# Altium schematic sheet signal-light-12.SchDoc
size A4; SheetNumber: 15; SheetTotal: 21
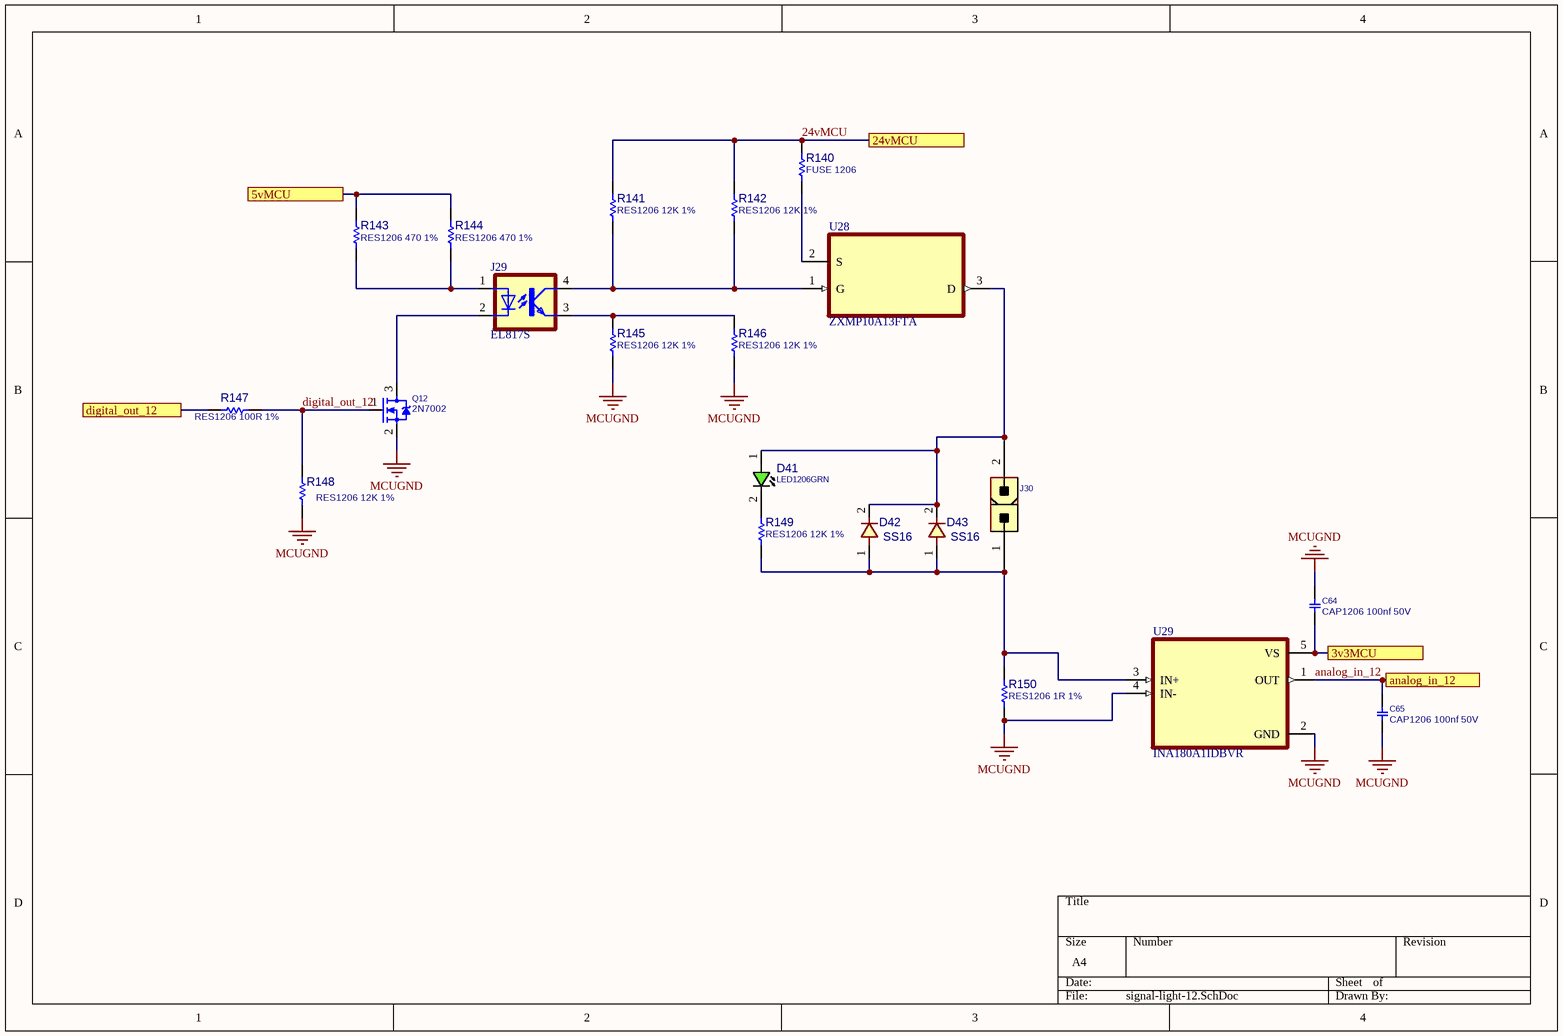
[diagram p0: signal-light-12.SchDoc]

## Parts
C64  CAP1206 100nf 50V  [C1206]
C65  CAP1206 100nf 50V  [C1206]
D41  LED1206GRN  [LED1206GRN]
D42  SS16  [D_SMA]
D43  SS16  [D_SMA]
J29  EL817S  [SOIC254P1030X460-4N]
J30  CONN_ATXPWR_2  [ATXPWR_2]  (value not drawn)
Q12  2N7002  [SOT23_3]
R140  FUSE 1206  [R1206]
R141  RES1206 12K 1%  [R1206]
R142  RES1206 12K 1%  [R1206]
R143  RES1206 470 1%  [R1206]
R144  RES1206 470 1%  [R1206]
R145  RES1206 12K 1%  [R1206]
R146  RES1206 12K 1%  [R1206]
R147  RES1206 100R 1%  [R1206]
R148  RES1206 12K 1%  [R1206]
R149  RES1206 12K 1%  [R1206]
R150  RES1206 1R 1%  [R1206]
U28  ZXMP10A13FTA  [SOT95P230X110-3N]
U29  INA180A1IDBVR  [SOT95P280X145-5N]

## Ports
3v3MCU, 5vMCU, 24vMCU, analog_in_12, digital_out_12

## Nets
MCUGND: C64.1 C65.2 Q12.2(SOURCE) R145.2 R146.2 R148.2 R150.2 U29.2(GND) U29.4(IN-)
3v3MCU: C64.2 U29.5(VS) ; port 3v3MCU
5vMCU: R143.2 R144.2 ; port 5vMCU
24vMCU: R140.1 R141.1 R142.1 ; port 24vMCU
analog_in_12: C65.1 U29.1(OUT) ; port analog_in_12
digital_out_12: Q12.1(GATE) R147.2 R148.1
digital_out_12: R147.1 ; port digital_out_12  [a separate net that carries the same name]
NetD41_1: D41.1(ANODE) D42.2 D43.2 J30.2 U28.3(D)
NetD41_2: D41.2(CATHODE) R149.1
NetD42_1: D42.1 D43.1 J30.1 R149.2 R150.1 U29.3(IN+)
NetJ29_1: J29.1(A) R143.1 R144.1
NetJ29_2: J29.2(C) Q12.3(DRAIN)
NetJ29_3: J29.3(EMIT) R145.1 R146.1
NetJ29_4: J29.4(COL) R141.2 R142.2 U28.1(G)
NetR140_2: R140.2 U28.2(S)

## Library data of the parts
C64 C65 = CAP_SMD_MLCC_1206: CAP, MLCC; PARAM: -, -%; MANF_P#: MANF_PART#; PARAM2: -V; PRICE: 100= 1$; MANF: -; ASSEMBLY: ASSEMBLY
D41 = LED_SMD_1206_GRN: LED, SMD, 1206, GREEN; PARAM: 20mA; DESC: DESCRIPTION; PARAM2: 2.2V; MANF: -; ASSEMBLY: ASSEMBLY; PRICE: 36t@Javan; MANF_P#: -; VALUE: LED1206GRN; MountType: SMT; PartType: LED
D42 D43 = DIODE_SMD_1N4001: DIODE, GENERAL PURPOSE, 50V/1A; DESC: DESCRIPTION; PARAM: 50V VRRM; PARAM2: 1A; MANF_P#: 1N4001; MANF: MANF; ASSEMBLY: ASSEMBLY; PRICE: PRICE; VALUE: SS16
J29 = EL817S: Optoisolator Transistor Output 5000Vrms 1 Channel 4-SMD; MF: Everlight Electronics; SnapEDA_Link: https://www.snapeda.com/parts/EL817S/Everlight+Electronics+Co+Ltd/view-part/?ref=snap; Package: SMD-4 Everlight Electronics Co Ltd; Value: *; MP: EL817S; Check_prices: https://www.snapeda.com/parts/EL817S/Everlight+Electronics+Co+Ltd/view-part/?ref=eda
J30 = CONN_ATXPWR_2: CONN, ATX POWER, 2 P; MANF: Molex; MANF_P#: 39281023; VALUE: CONN_ATXPWR_2; MountType: THD; PACKAGE: ATXPWR-2pin; Part Type: Conn.
Q12 = MOSN_2N7002_SOT23: MOSFET, N-CH, 60V, 0.3A; MANF: NXP; ASSEMBLY: ASSEMBLY; MANF_P#: 2N7002; PARAM2: 60v; PARAM: 0.3A; PRICE: 0.3t@Javan; VALUE: 2N7002
R140-R150 = RES_SMD_1206: RESISTOR, SMD; PARAM: 1%, 0.25W; DESC: DESCRIPTION; DIST#: MOUSER; MANF_P#: -; MANF: -; ASSEMBLY: ASSEMBLY; PRICE: -; PARAM2: -
U28 = ZXMP10A13FTA: P-Channel 100 V 600mA (Ta) 625mW (Ta) Surface Mount SOT-23-3; MF: Diodes Inc.; Purchase-URL: https://pricing.snapeda.com/search/part/ZXMP10A13FTA/?ref=eda; Package: SOT-23-3 Diodes Inc.; SnapEDA_Link: https://www.snapeda.com/parts/ZXMP10A13FTA/Diodes+Inc./view-part/?ref=snap; Availability: In Stock; Value: *; MP: ZXMP10A13FTA; Check_prices: https://www.snapeda.com/parts/ZXMP10A13FTA/Diodes+Inc./view-part/?ref=eda; Price: None
U29 = INA180A1IDBVR: 26V, 350kHz current sense amplifier; MF: Texas Instruments; SnapEDA_Link: https://www.snapeda.com/parts/INA180A1IDBVR/Texas+Instruments/view-part/?ref=snap; Package: SOT-23-5 Texas Instruments; Value: *; MP: INA180A1IDBVR; Check_prices: https://www.snapeda.com/parts/INA180A1IDBVR/Texas+Instruments/view-part/?ref=eda